# EasyEDA Pro project 集成板.eprj, board 集成板3.1(国赛)
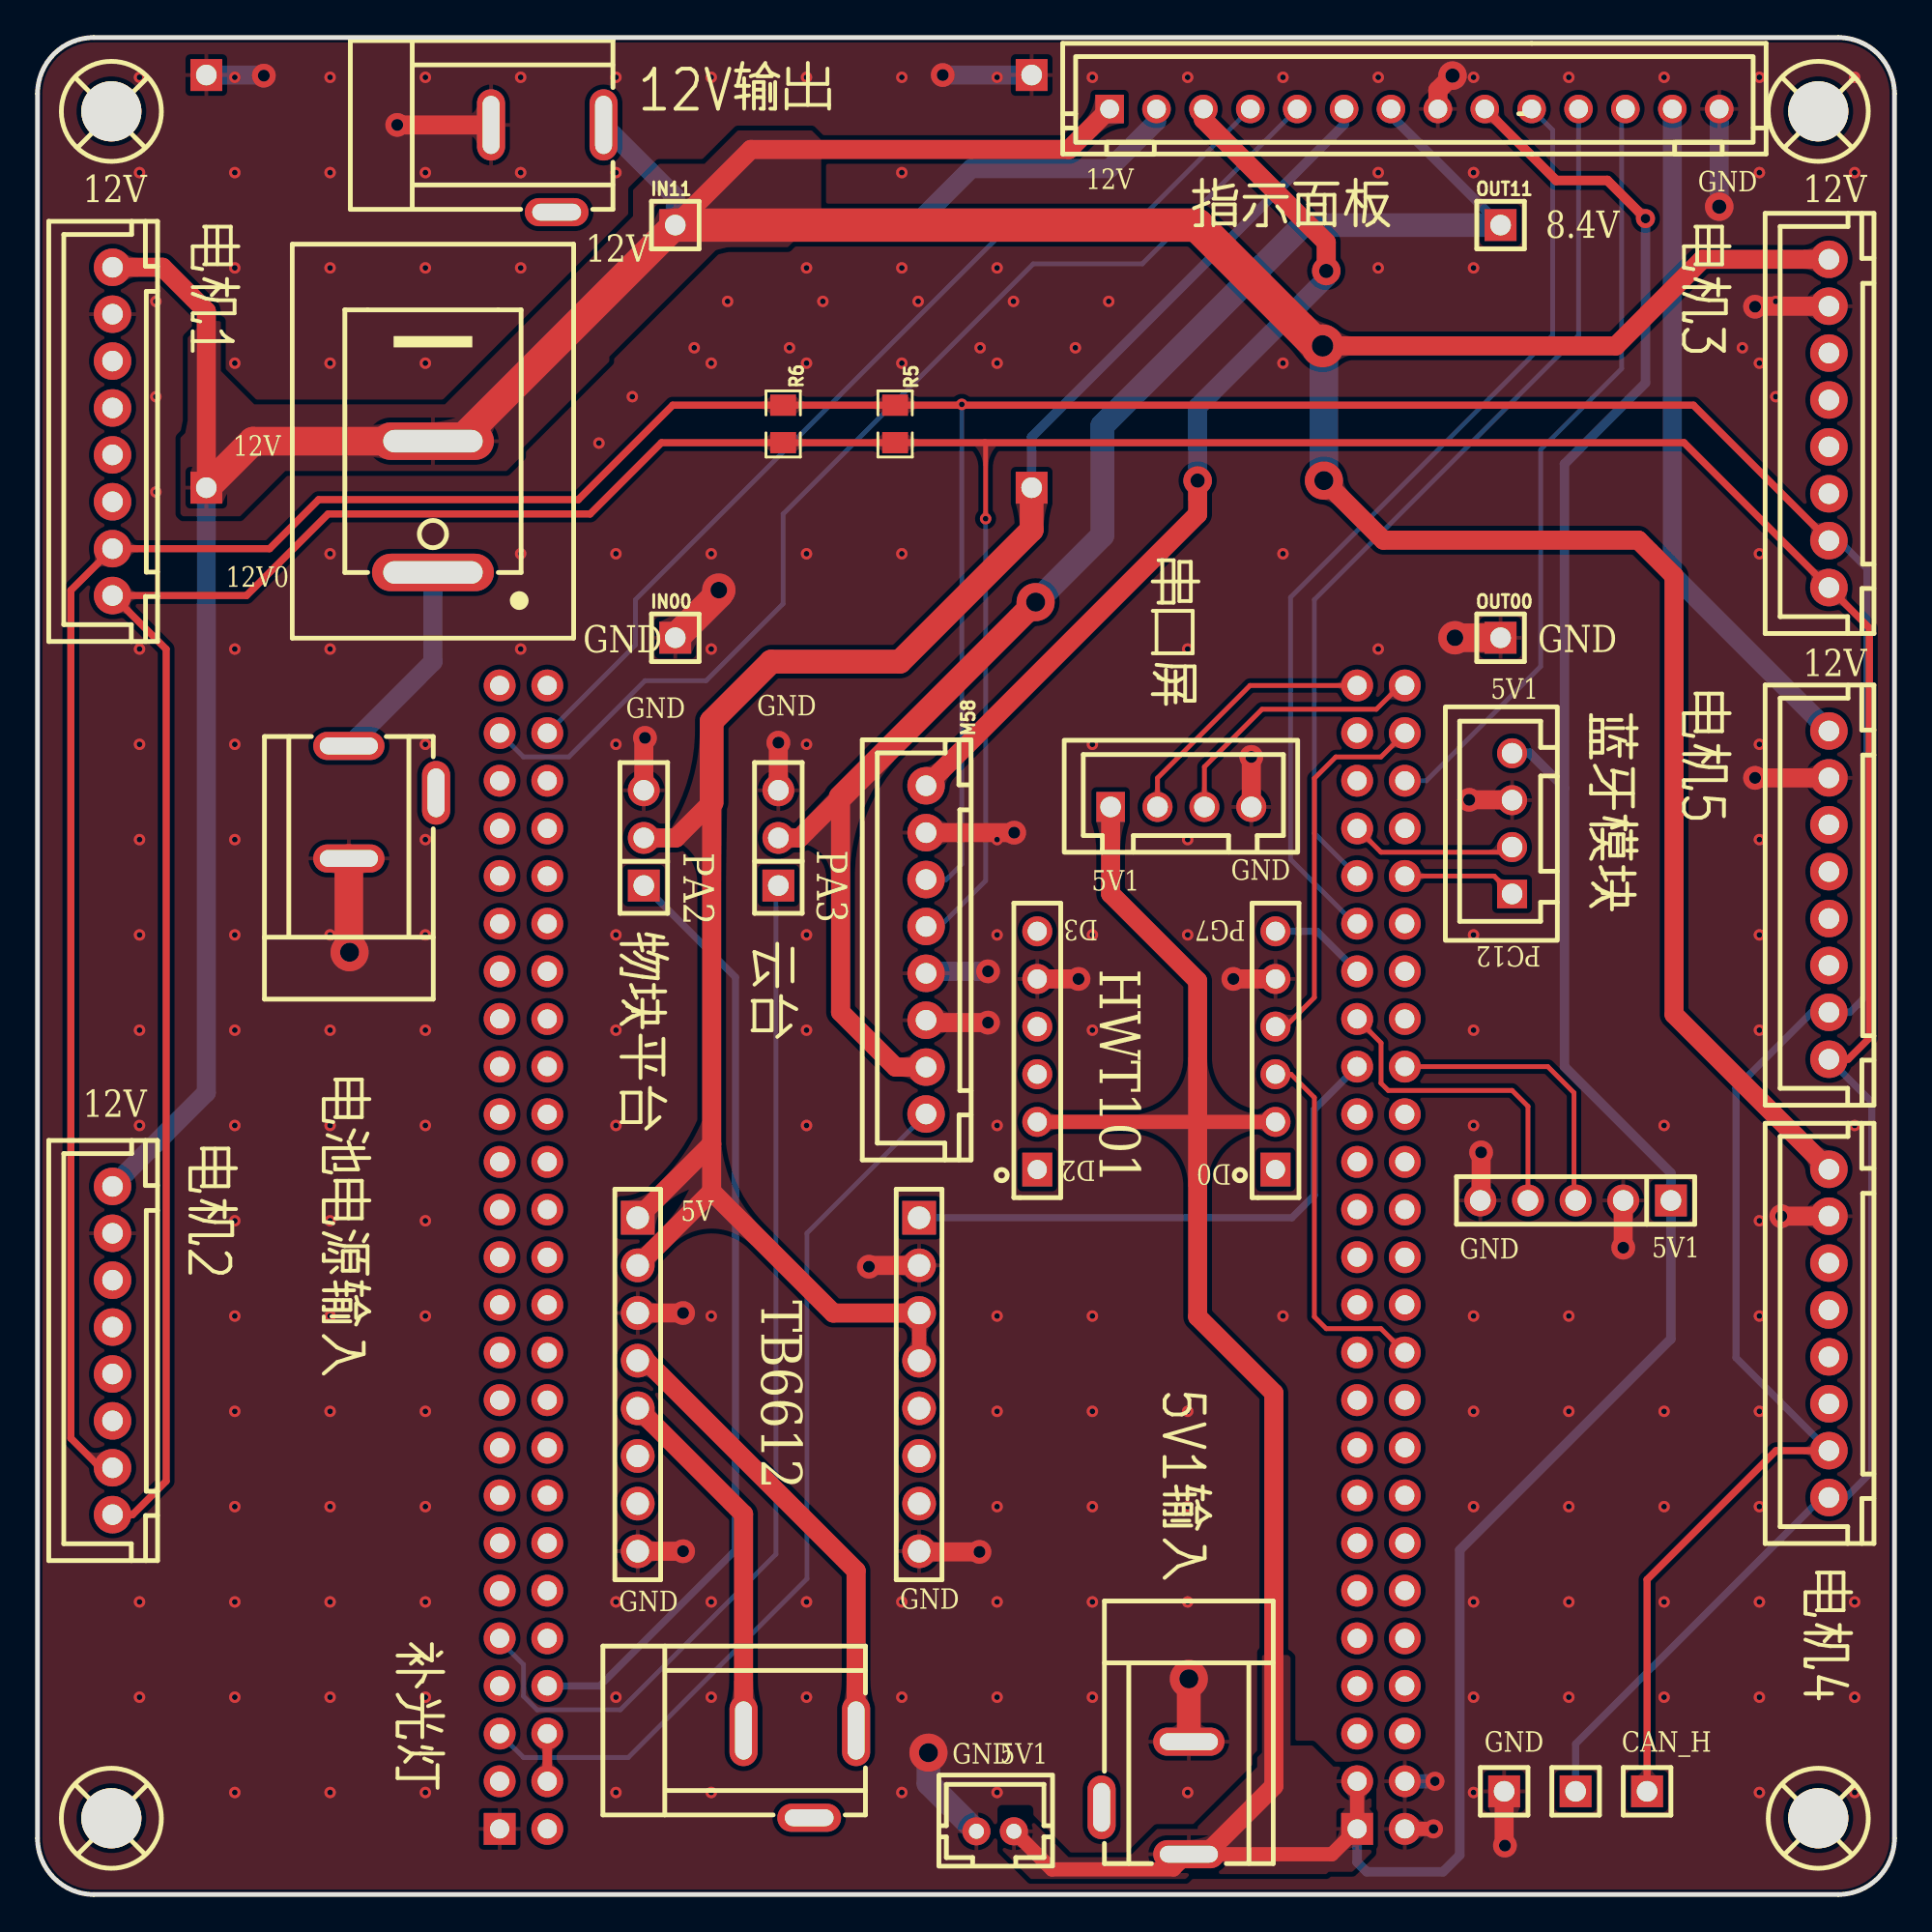
[diagram p10: board, top side]
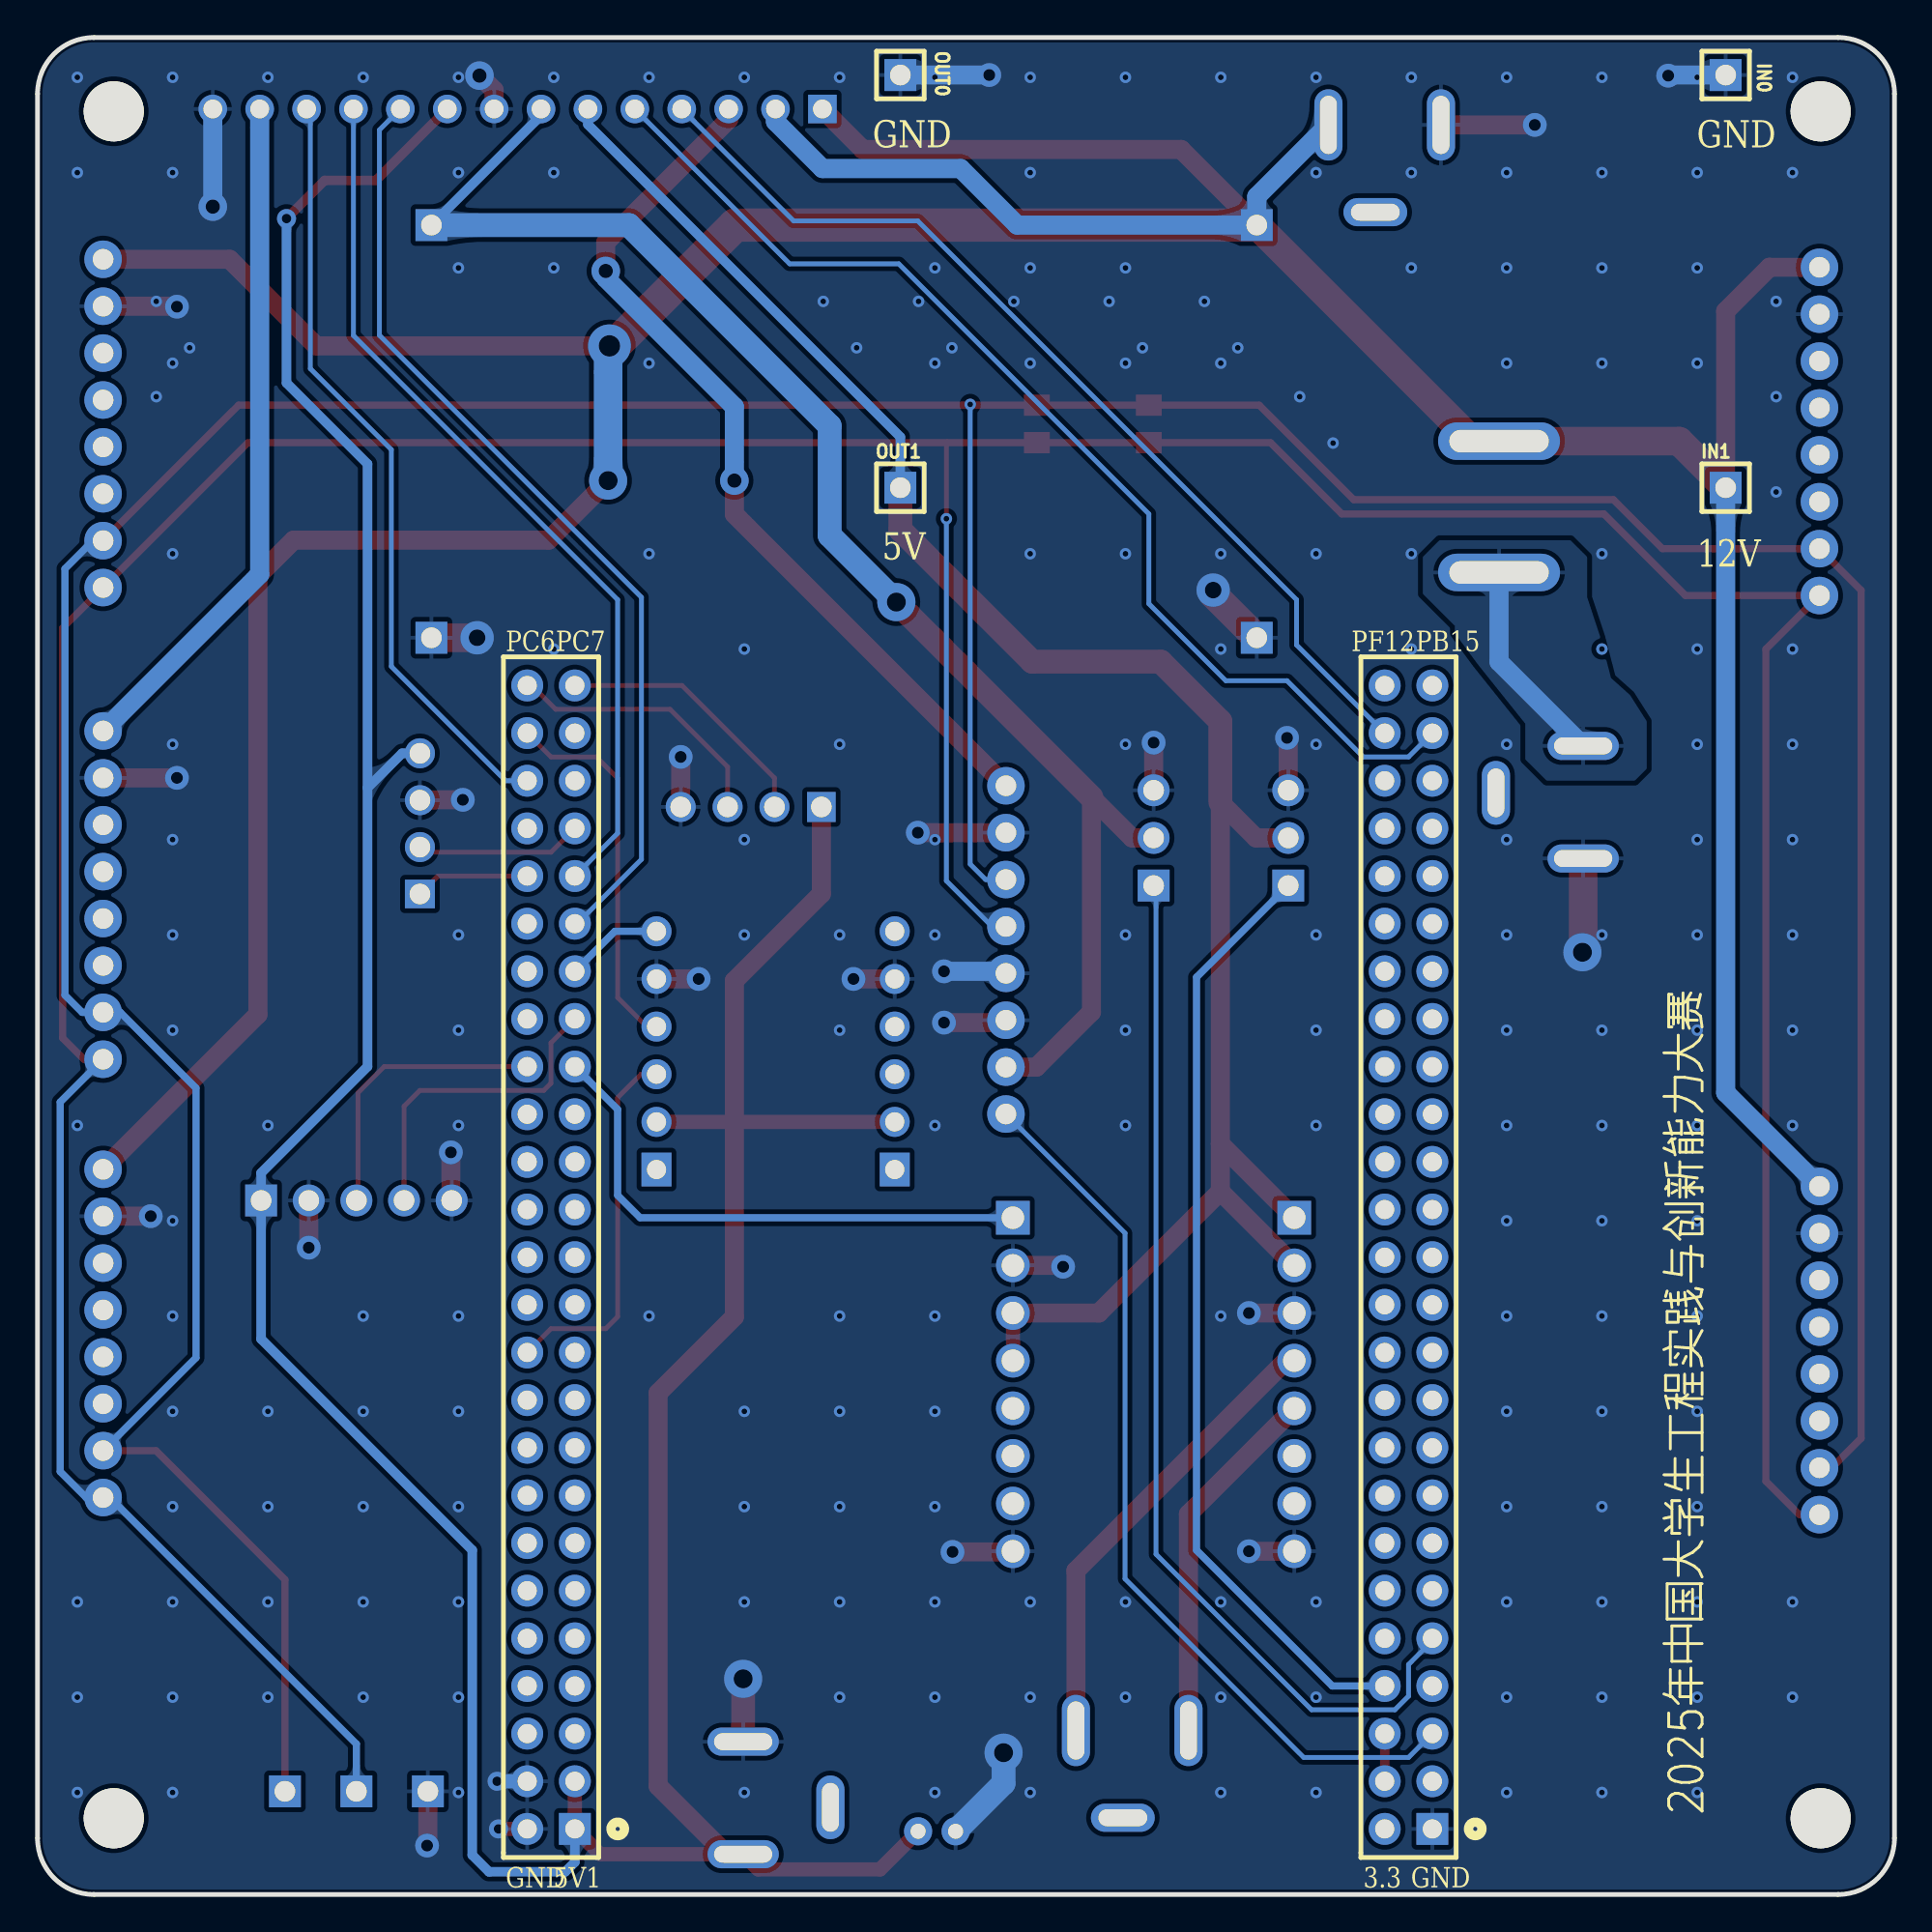
[diagram p11: board, bottom side, seen from below]

Outline 99 x 99 mm; copper layers: Top Layer, Bottom Layer. Coordinates in mm from the lower left corner of the outline.
Outline path: 0,96 0,3 arc(0.88,0.88) 3,0 96,0 arc(98.12,0.88) 99,3 99,96 arc(98.12,98.12) 96,99 3,99 arc(0.88,98.12) 0,96
Stack: Top Layer 0.035mm / Dielectric1 1.51mm FR4 er 4.5 / Bottom Layer 0.035mm

## Design rules (mm)
template: JLCPCB Capability(Two Layers Board)
spacing copperThickness1oz (default): track to track 0.102, other pairs 0.152 to 0.3
spacing copperThickness2oz: track to track 0.203, other pairs 0.152 to 0.3
track width copperThickness1oz (default): min 0.127, default 0.254, max 2.54
track width copperThickness2oz: min 0.203, default 0.254, max 2.54
differential pair differentialPair (default): width min 0.127, default 0.254, max 2.54; gap min 0.152, default 0.152
via viaSize (default): diameter min 0.5, default 0.61, max 10; hole min 0.3, default 0.305, max 6.3

## Placement (name value [footprint] x y rotation side)
CN8  ZX-XH2.54-4PZZ  [CONN-TH_4P-P2.50_4PIN]  78.61 57.09 90 top
CN12  ZX-XH2.54-4PZZ  [CONN-TH_4P-P2.50_4PIN]  60.96 57.98 0 top
CN13  ZX-XH2.54-14PZZ  [CONN-TH_14P-P2.50_ZX-XH2.54-14PZZ]  73.41 95.19 0 top
DC2  DC-005-A200  [DC-IN-TH_DC-005-A200]  59.06 5.15 270 top
DC4  DC-005-A200  [DC-IN-TH_DC-005-A200]  40.64 6.42 0 top
DC5  DC-005-A200  [DC-IN-TH_DC-005-A200]  18.92 58.23 90 top
DC6  DC-005-A200  [DC-IN-TH_DC-005-A200]  27.18 92.02 0 top
H1  PZ254V-11-05P  [HDR-TH_5P-P2.54-V-M]  82 37 180 top
H2  PZ254V-11-01P  [HDR-TH_1P-P2.54-V-M]  85.81 5.5 270 top
H3  PZ254V-11-01P  [HDR-TH_1P-P2.54-V-M]  82 5.5 270 top
H4  PZ254V-11-01P  [HDR-TH_1P-P2.54-V-M]  78.19 5.5 270 top
IN00  2.54-1*1P针  [HDR-TH_1P-P2.54-V-M]  34 67 0 top
IN0  2.54-1*1P针  [HDR-TH_1P-P2.54-V-M]  9 97 180 bottom
IN1  2.54-1*1P针  [HDR-TH_1P-P2.54-V-M]  9 75 180 bottom
IN11  2.54-1*1P针  [HDR-TH_1P-P2.54-V-M]  34 89 0 top
M11  ZX-XH2.54-8PZZ  [CONN-TH_8P-P2.50-XH2.54-8P]  4 78 270 top
M22  ZX-XH2.54-8PZZ  [CONN-TH_8P-P2.50-XH2.54-8P]  4 29 270 top
M33  ZX-XH2.54-8PZZ  [CONN-TH_8P-P2.50-XH2.54-8P]  95.5 78.43 270 top
M44  ZX-XH2.54-8PZZ  [CONN-TH_8P-P2.50-XH2.54-8P]  95.5 29.91 270 top
M55  ZX-XH2.54-8PZZ  [CONN-TH_8P-P2.50-XH2.54-8P]  95.5 53.28 270 top
M58  ZX-XH2.54-8PZZ  [CONN-TH_8P-P2.50-XH2.54-8P]  47.37 50.36 270 top
OUT00  2.54-1*1P针  [HDR-TH_1P-P2.54-V-M]  78 67 0 top
OUT0  2.54-1*1P针  [HDR-TH_1P-P2.54-V-M]  53 97 180 bottom
OUT1  2.54-1*1P针  [HDR-TH_1P-P2.54-V-M]  53 75 180 bottom
OUT11  2.54-1*1P针  [HDR-TH_1P-P2.54-V-M]  78 89 0 top
P1  2.54-1*8P母环保  [HDR-TH_8P-P2.54-V-F-1]  32 27.19 270 top
P2  2.54-1*8P母环保  [HDR-TH_8P-P2.54-V-F-1]  47 27.19 270 top
R5  120Ω  [R0805]  45.72 78.4 270 top
R6  120Ω  [R0805]  39.75 78.4 270 top
SCREW1  -  [M3螺丝]  4 95 0 top
SCREW2  -  [M3螺丝]  4 4 0 top
SCREW3  -  [M3螺丝]  95 95 0 top
SCREW4  -  [M3螺丝]  95 4 0 top
U2  PM254-1-06-Z-8.5  [hdr-th_6p-p2.54-v-f]  66 45 90 top
U3  PM254-1-06-Z-8.5  [hdr-th_6p-p2.54-v-f]  53.3 45 90 top
U21  ZX-PM2.54-2-25PY  [HDR-TH_50P-P2.54-V-F-R2-C25-S2.54-1]  25.91 33.98 90 bottom
U22  ZX-PM2.54-2-25PY  [HDR-TH_50P-P2.54-V-F-R2-C25-S2.54-1]  71.62 33.98 90 bottom
U23  WAFER-PH2.0-2PZZ  [CONN-TH_2P-P2.00_HC-PH-2A-M]  51.05 3.37 0 top
U37  HB-PH3-25413PB2GOP  [HDR-TH_3P-P2.54-V-M]  32.32 56.33 90 top
U38  HB-PH3-25413PB2GOP  [HDR-TH_3P-P2.54-V-M]  39.5 56.33 90 top
U41  SS11-RBIWG-R20-R  [sw-th_l21.0-w15.0_ss11-rbiwg-r20-r]  21.08 73.98 90 top

## Footprints (pads in the part's own frame, mm; a bottom-side part is the same pattern mirrored in y, then rotated)
CONN-TH_2P-P2.00_HC-PH-2A-M
  round 1.5 hole 0.8: 1(-1,0) 2(1,0)
CONN-TH_4P-P2.50_4PIN
  rect 1.524x1.6 hole 1.1: 1(-3.75,0)
  round 1.6 hole 1.1: 2(-1.25,0) 3(1.25,0) 4(3.75,0)
CONN-TH_8P-P2.50-XH2.54-8P
  round 2 hole 1.1: 1(8.75,0) 2(6.25,0) 3(3.75,0) 4(1.25,0) 5(-1.25,0) 6(-3.75,0) 7(-6.25,0) 8(-8.75,0)
CONN-TH_14P-P2.50_ZX-XH2.54-14PZZ
  rect 1.524x1.524 hole 1: 1(-16.25,0)
  round 1.524 hole 1: 2(-13.75,0) 3(-11.25,0) 4(-8.75,0) 5(-6.25,0) 6(-3.75,0) 7(-1.25,0) 8(1.25,0) 9(3.75,0) 10(6.25,0) 11(8.75,0) 12(11.25,0) 13(13.75,0) 14(16.25,0)
DC-IN-TH_DC-005-A200
  oval 1.5x3.8 hole 0.9x3.1: 1(3,2.325) 2(-3,2.325)
  oval 3.4x1.5 hole 2.6x0.9: 3(0.5,-2.325)
HDR-TH_1P-P2.54-V-M
  rect 1.7x1.7 hole 1.1: 1(0,0)
HDR-TH_3P-P2.54-V-M
  rect 1.7x1.7 hole 1.1: 1(-2.54,0)
  round 1.7 hole 1.1: 2(0,0) 3(2.54,0)
HDR-TH_5P-P2.54-V-M
  rect 1.7x1.7 hole 1.1: 1(-5.08,0)
  round 1.7 hole 1.1: 2(-2.54,0) 3(0,0) 4(2.54,0) 5(5.08,0)
hdr-th_6p-p2.54-v-f
  rect 1.8x1.6 hole 1.02: 1(-6.35,0)
  round 1.6 hole 1.02: 2(-3.81,0) 3(-1.27,0) 4(1.27,0) 5(3.81,0) 6(6.35,0)
HDR-TH_8P-P2.54-V-F-1
  rect 1.8x1.8 hole 1.2: 1(-8.89,0)
  round 1.8 hole 1.2: 2(-6.35,0) 3(-3.81,0) 4(-1.27,0) 5(1.27,0) 6(3.81,0) 7(6.35,0) 8(8.89,0)
HDR-TH_50P-P2.54-V-F-R2-C25-S2.54-1
  rect 1.7x1.7 hole 1.02: 1(-30.48,-1.27)
  round 1.7 hole 1.02: 2(-30.48,1.27) 3(-27.94,-1.27) 4(-27.94,1.27) 5(-25.4,-1.27) 6(-25.4,1.27) 7(-22.86,-1.27) 8(-22.86,1.27) 9(-20.32,-1.27) 10(-20.32,1.27) 11(-17.78,-1.27) 12(-17.78,1.27) 13(-15.24,-1.27) 14(-15.24,1.27) 15(-12.7,-1.27) 16(-12.7,1.27) 17(-10.16,-1.27) 18(-10.16,1.27) 19(-7.62,-1.27) 20(-7.62,1.27) 21(-5.08,-1.27) 22(-5.08,1.27) 23(-2.54,-1.27) 24(-2.54,1.27) 25(0,-1.27) 26(0,1.27) 27(2.54,-1.27) 28(2.54,1.27) 29(5.08,-1.27) 30(5.08,1.27) 31(7.62,-1.27) 32(7.62,1.27) 33(10.16,-1.27) 34(10.16,1.27) 35(12.7,-1.27) 36(12.7,1.27) 37(15.24,-1.27) 38(15.24,1.27) 39(17.78,-1.27) 40(17.78,1.27) 41(20.32,-1.27) 42(20.32,1.27) 43(22.86,-1.27) 44(22.86,1.27) 45(25.4,-1.27) 46(25.4,1.27) 47(27.94,-1.27) 48(27.94,1.27) 49(30.48,-1.27) 50(30.48,1.27)
M3螺丝
  round 3.2 hole 3.2: 1(-0.064,0.064)
R0805
  rect 1.133x1.377 smd: 1(-1,0) 2(1,0)
sw-th_l21.0-w15.0_ss11-rbiwg-r20-r
  oval 2x6.5 hole 1.2x5.3: 1(-3.5,0) 2(3.5,0)

## Nets
As in the schematic.

Pads without a net: DC2 3; DC4 3; DC5 3; DC6 3; M11 3 4 5 6; M22 3 4 5 6; M33 3 4 5 6; M44 3 4 5 6; M55 3 4 5 6; P1 6 7; P2 5 6 7; SCREW1 1; SCREW2 1; SCREW3 1; SCREW4 1; U3 3 4

## Via types
v1: diameter 0.61, hole 0.305, Top Layer to Bottom Layer, 201 vias
v2: diameter 2.286, hole 1.143, Top Layer to Bottom Layer, 1 via
v3: diameter 2.032, hole 1.016, Top Layer to Bottom Layer, 5 vias
v4: diameter 1.27, hole 0.635, Top Layer to Bottom Layer, 22 vias
v5: diameter 1.524, hole 0.762, Top Layer to Bottom Layer, 4 vias
v6: diameter 1.778, hole 0.889, Top Layer to Bottom Layer, 2 vias
v7: diameter 1.016, hole 0.508, Top Layer to Bottom Layer, 3 vias

## Routing (per net, layer and track width the routed paths; a pad name or vN(x,y) marks a point on that pad's centre or on a via; arc(x,y) is an arc through that point)
5V: length 107.5
  Top Layer w0.762: P2.3 P2.4
  Top Layer w1.016: 35.94,40.02 P1.1 ; 35.94,40.02 35.94,58.23 34.04,56.33 U37.2 ; 35.94,40.02 35.94,37.48 ; 35.94,37.48 32,33.54 ; 35.94,37.48 42.42,31 P2.3
  Top Layer w1.27: 35.94,58.23 35.94,62.55 39.12,65.73 45.97,65.73 53,72.75 OUT1.1
  Bottom Layer w0.508: CN13.6 69.66,94.36 53,77.7 OUT1.1
5V1: length 214.6
  Top Layer w0.508: CN13.9 80.97,91.38 83.69,91.38 v7(85.72,89.35)
  Top Layer w0.762: U22.3 U22.1 69,2.15 62.28,2.15 ; U3.2 U2.2 ; DC2.1 60.57,1.34 54.09,1.34 U23.2
  Top Layer w1.016: DC2.1 62.28,2.15 65.91,5.78 65.91,26.74 61.85,30.8 61.85,48.71 57.21,53.35 CN12.1
  Bottom Layer w0.508: CN8.4 79.56,60.84 81.41,59 ; 81.41,59 81.41,76.27 85.72,80.58 v7(85.72,89.35) ; 81.41,59 81.41,44.14 87.08,38.46 H1.1 87.08,29.62 75.82,18.36 75.82,2.1 74.93,1.21 70.87,1.21 70.35,1.72 U22.1
8.4V: length 81.3
  Top Layer w1.016: U38.2 40.64,56.33 42.81,58.5 42.81,47.04 45.75,44.11 M58.2
  Top Layer w1.27: v3(53.21,68.9) 42.81,58.5
  Bottom Layer w0.508: OUT11.1 72.16,94.84 CN13.7
  Bottom Layer w1.27: OUT11.1 67.47,89 56.77,78.3 56.77,72.46 v3(53.21,68.9)
12V: length 275.9
  Top Layer w1.016: M44.8 87.25,46.92 87.25,70.3 85.34,72.2 71.75,72.2 v3(68.58,75.38) ; M11.8 6.66,86.75 9,84.41 IN1.1 ; IN11.1 38.03,93.03 55,93.03 CN13.1 ; M33.8 88.76,87.18 84.14,82.56 v2(68.51,82.56)
  Top Layer w1.524: IN1.1 11.48,77.48 U41.2 22.48,77.48 IN11.1
  Top Layer w1.778: v2(68.51,82.56) 68.26,82.56 61.82,89 IN11.1
  Bottom Layer w1.016: IN1.1 9,42.75 M22.8 ; DC6.1 34,90.52 IN11.1 46.77,89 49.78,92.02 57.15,92.02 59.66,94.52 CN13.2
  Bottom Layer w1.524: v3(68.58,75.38) 68.58,82.49 v2(68.51,82.56)
12V0: length 11.1
  Bottom Layer w1.016: DC5.1 21.08,65.72 U41.1
12V5: length 36.6
  Bottom Layer w1.016: CN13.13 87.16,70.38 M55.8
12V6: length 47.6
  Top Layer w1.016: M58.8 61.85,73.59 v5(61.85,75.38) ; v5(68.71,86.55) 68.71,88.08 62.16,94.63 CN13.3
  Bottom Layer w1.016: v5(61.85,75.38) 61.85,79.31 68.71,86.17 v5(68.71,86.55)
GND: length 98.3
  Top Layer w0.762: U22.2 v7(74.42,3.5)
  Top Layer w1.016: M58.3 47.5,46.48 v4(50.67,46.48) ; v4(78.23,2.61) 78.19,2.65 H4.1 ; M58.7 v4(52.07,56.61) ; v5(75.44,96.97) 74.66,96.19 CN13.8 ; v4(50.22,18.26) 47.01,18.26 46.92,18.36 ; DC6.2 v4(19.18,94.34) ; M33.7 91.59,84.68 v4(91.57,84.65) ; v4(76.96,39.56) 76.96,37.04 H1.5 ; M44.7 v4(92.96,36.16) ; v4(76.33,58.36) 78.59,58.36 CN8.3 ; U37.3 32.32,61.6 v4(32.38,61.66) ; 47,33.54 44.39,33.54 v4(44.32,33.47) ; M55.7 v4(91.57,59.53) ; U3.5 v4(55.5,48.81) ; CN12.4 v4(64.71,60.65) ; H1.2 v4(84.54,34.48) ; U2.5 v4(63.75,48.81) ; U38.3 v4(39.5,61.41) ; P1.3 v4(34.42,31) ; 32,18.3 v4(34.42,18.3)
  Top Layer w1.27: DC2.2 v3(61.38,11.5)
  Top Layer w1.524: v3(16.64,50.23) 16.6,50.27 DC5.2 ; OUT00.1 v6(75.56,67) ; v6(36.32,69.54) 36.32,69.32 IN00.1
  Bottom Layer w0.762: U22.4 v7(74.5,6.04)
  Bottom Layer w1.016: M58.4 47.48,49.22 v4(50.67,49.22) ; IN0.1 12.03,97 v4(12.06,96.97) ; OUT0.1 v4(48.26,97) ; CN13.14 v5(89.66,89.98)
  Bottom Layer w1.27: v3(47.5,7.56) 47.5,5.93 U23.1
  vias: v1(5.44,96.88) v1(5.44,91.8) v1(5.44,66.4) v1(5.44,61.32) v1(5.44,56.24) v1(5.44,51.16) v1(5.44,46.08) v1(5.44,41) v1(5.44,15.6) v1(5.44,10.52) v1(6.31,84.93) v1(6.31,79.85) v1(6.31,74.77) v1(10.52,96.88) v1(10.52,91.8) v1(10.52,86.72) v1(10.52,81.64) v1(10.52,66.4) v1(10.52,61.32) v1(10.52,56.24) v1(10.52,51.16) v1(10.52,46.08) v1(10.52,41) v1(10.52,35.92) v1(10.52,30.84) v1(10.52,25.76) v1(10.52,20.68) v1(10.52,15.6) v1(10.52,10.52) v1(10.52,5.44) v1(15.6,96.88) v1(15.6,91.8) v1(15.6,86.72) v1(15.6,81.64) v1(15.6,71.48) v1(15.6,66.4) v1(15.6,51.16) v1(15.6,46.08) v1(15.6,41) v1(15.6,35.92) v1(15.6,30.84) v1(15.6,25.76) v1(15.6,20.68) v1(15.6,15.6) v1(15.6,10.52) v1(15.6,5.44) v1(20.68,96.88) v1(20.68,91.8) v1(20.68,86.72) v1(20.68,81.64) v1(20.68,61.32) v1(20.68,56.24) v1(20.68,51.16) v1(20.68,46.08) v1(20.68,41) v1(20.68,35.92) v1(20.68,30.84) v1(20.68,25.76) v1(20.68,20.68) v1(20.68,15.6) v1(20.68,10.52) v1(20.68,5.44) v1(25.76,96.88) v1(25.76,91.8) v1(25.76,86.72) v1(25.76,71.48) v1(25.76,66.4) v1(29.93,77.38) v1(30.84,96.88) v1(30.84,91.8) v1(30.84,71.48) v1(30.84,61.32) v1(30.84,51.16) v1(30.84,46.08) v1(30.84,41) v1(30.84,15.6) v1(30.84,10.52) v1(30.84,5.44) v1(31.71,79.85) v1(35.01,82.46) v1(35.92,96.88) v1(35.92,81.64) v1(35.92,71.48) v1(35.92,66.4) v1(35.92,30.84) v1(35.92,15.6) v1(35.92,10.52) v1(35.92,5.44) v1(36.79,84.93) v1(40.09,82.46) v1(41,96.88) v1(41,86.72) v1(41,81.64) v1(41,71.48) v1(41,61.32) v1(41,51.16) v1(41,46.08) v1(41,41) v1(41,15.6) v1(41,10.52) v1(41.87,84.93) v1(46.08,96.88) v1(46.08,91.8) v1(46.08,86.72) v1(46.08,81.64) v1(46.08,71.48) v1(46.08,15.6) v1(46.08,10.52) v1(46.08,5.44) v1(46.95,84.93) v1(50.25,82.46) v1(51.16,96.88) v1(51.16,86.72) v1(51.16,81.64) v1(51.16,56.24) v1(51.16,51.16) v1(51.16,41) v1(51.16,30.84) v1(51.16,25.76) v1(51.16,20.68) v1(51.16,15.6) v1(51.16,10.52) v1(51.16,5.44) v1(52.03,84.93) v1(55.33,82.46) v1(56.24,96.88) v1(56.24,61.32) v1(56.24,51.16) v1(56.24,46.08) v1(56.24,30.84) v1(56.24,25.76) v1(56.24,20.68) v1(56.24,15.6) v1(56.24,10.52) v1(57.11,84.93) v1(61.32,96.88) v1(61.32,66.4) v1(61.32,56.24) v1(61.32,51.16) v1(61.32,25.76) v1(61.32,20.68) v1(61.32,15.6) v1(61.32,5.44) v1(66.4,96.88) v1(66.4,81.64) v1(66.4,71.48) v1(66.4,30.84) v1(71.48,96.88) v1(71.48,91.8) v1(71.48,86.72) v1(71.48,66.4) v1(76.56,96.88) v1(76.56,91.8) v1(76.56,86.72) v1(76.56,51.16) v1(76.56,46.08) v1(76.56,41) v1(76.56,30.84) v1(76.56,25.76) v1(76.56,20.68) v1(76.56,15.6) v1(76.56,10.52) v1(76.56,5.44) v1(81.64,96.88) v1(81.64,30.84) v1(81.64,25.76) v1(81.64,20.68) v1(81.64,15.6) v1(81.64,10.52) v1(86.72,96.88) v1(86.72,41) v1(86.72,25.76) v1(86.72,20.68) v1(86.72,15.6) v1(86.72,10.52) v1(90.89,82.46) v1(91.8,96.88) v1(91.8,91.8) v1(91.8,81.64) v1(91.8,71.48) v1(91.8,61.32) v1(91.8,56.24) v1(91.8,51.16) v1(91.8,46.08) v1(91.8,35.92) v1(91.8,30.84) v1(91.8,25.76) v1(91.8,20.68) v1(91.8,15.6) v1(91.8,10.52) v1(91.8,5.44) v1(92.67,84.93) v1(92.67,79.85) v1(96.88,96.88) v1(96.88,91.8) v1(96.88,41) v1(96.88,15.6) v1(96.88,10.52) v1(96.88,5.44)
VCC3.3VREF: length 2.5
  Top Layer w0.508: U21.6 U21.4
AO1: length 24.8
  Top Layer w1.016: DC4.1 43.64,17.26 32.44,28.46 P1.4
AO2: length 19.5
  Top Layer w1.016: 32,25.92 37.64,20.28 DC4.2
CAN_H: length 255.3
  Top Layer w0.381: M22.2 3.35,22.75 1.78,24.32 1.78,69.53 M11.2 12.37,71.75 14.99,74.36 28.83,74.36 33.87,79.4 R6.1 R5.1 88.28,79.4 M33.2 ; H2.1 85.81,16.79 92.68,23.66 M44.2
  Bottom Layer w0.254: M58.6 48.45,54.11 49.28,54.93 v1(49.28,79.44)
  Bottom Layer w0.381: M44.2 90.55,28.62 90.55,42.99 94.59,47.03 M55.2 96.62,47.03 97.54,47.95 97.54,70.68 96.04,72.18 M33.2
CAN_L: length 252.4
  Top Layer w0.254: 50.5,77.4 50.55,77.36 v1(50.55,73.35)
  Top Layer w0.381: M22.1 5.07,20.25 6.86,22.04 6.86,66.39 M11.1 11.14,69.25 15.49,73.6 29.46,73.6 33.26,77.4 R6.2 R5.2 87.78,77.4 M33.1 97.66,67.52 97.66,45.66 96.53,44.53 M55.1
  Bottom Layer w0.254: M58.5 48.11,51.61 50.55,54.04 v1(50.55,73.35)
  Bottom Layer w0.381: H3.1 82,8.03 95.14,21.16 M44.1 96.41,21.16 97.79,22.55 97.79,42.24 M55.1
PA1: length 48.3
  Bottom Layer w0.254: U21.5 25.91,7.31 31.5,7.31 41.02,16.83 41.02,35.26 M58.1
PA2: length 50.5
  Bottom Layer w0.381: U37.1 37.21,48.9 37.21,18.35 29.97,11.12 U21.8
PA3: length 56.5
  Bottom Layer w0.254: U21.9 24.64,13.53 25.91,12.26 25.91,10.57 26.63,9.85 31.07,9.85 39.37,18.14 39.37,53.66 U38.1
PA6: length 29.4
  Bottom Layer w0.381: P2.1 66.87,36.08 68.07,37.28 68.07,41.86 U22.33
PA8: length 47.7
  Bottom Layer w0.254: CN13.11 82.16,83.11 68.07,69.03 68.07,56.58 U22.41
PA11: length 17.3
  Top Layer w0.254: U22.35 71.63,45.4 71.63,43.25 72.01,42.87 78.61,42.87 79.46,42.02 H1.4
PA12: length 15.4
  Top Layer w0.254: U22.34 80.52,44.14 81.91,42.74 81.91,37.08 H1.3
PC6: length 14.6
  Top Layer w0.254: U22.50 72.64,64.46 71.37,63.19 65.28,63.19 62.21,60.12 CN12.3
PC7: length 14.2
  Top Layer w0.254: U22.49 64.64,64.46 59.71,59.52 CN12.2
PC9: length 51.2
  Bottom Layer w0.254: CN13.10 80.77,94.07 80.77,83.12 66.8,69.16 66.8,55.19 70.23,51.76 U22.39
PC12: length 6.1
  Top Layer w0.254: CN8.1 77.66,54.3 U22.42
PD2: length 8.9
  Top Layer w0.254: U22.43 71.62,55.57 78.34,55.57 CN8.2
PD5: length 19.9
  Top Layer w0.254: U2.3 66.83,43.73 68.07,42.48 68.07,30.8 68.71,30.17 71.62,30.17 U22.22
PD6: length 20.2
  Top Layer w0.254: U2.4 66.52,46.27 68.07,47.82 68.07,59.5 69.22,60.65 71.62,60.65 U22.48
PF0: length 60.2
  Bottom Layer w0.254: U21.47 25.91,60.65 28.32,60.65 32.38,64.71 35.65,64.71 39.75,68.81 39.75,73.6 53.09,86.94 58.9,86.94 CN13.5
PF1: length 52.7
  Bottom Layer w0.254: CN13.4 58.69,89.22 52.07,89.22 31.88,69.03 31.88,66.61 U21.48
PG7: length 5.2
  Bottom Layer w0.381: U2.6 68.22,51.35 U22.37
PG15: length 41.4
  Bottom Layer w0.254: U22.46 74.04,59.38 80.14,65.47 80.14,77.03 84.46,81.35 84.46,94.99 CN13.12

## Copper pours and planes (outline as drawn; the poured copper is in the pictures)
5V1 on Top Layer: 61.47,1.08 68.71,1.08 68.83,1.21 70.1,1.21 71.12,2.23 71.12,6.41 70.71,6.82 69.08,6.82 67.96,7.94 66.8,7.94 66.8,12.64 66.68,12.77 65.41,12.77 65.28,12.89 65.28,7.56 65.02,7.31 65.02,6.8 61.85,3.62 61.85,3.5 59.69,3.5 58.18,1.99 58.18,1.98 54.98,1.98 52.83,4.13 52.83,4.51 51.44,4.51 51.44,2.35 52.96,0.83 61.21,0.83
12V on Top Layer: 7.75,73.47 7.62,73.6 7.62,77.66 7.87,77.92 8,78.55 8,83 8.51,83.51 8.51,83.89 9.78,83.89 9.78,81.22 11.56,79.44 21.72,79.44 31.75,89.47 31.75,90.87 33.15,92.27 35.56,92.27 37.34,94.05 41.28,94.05 41.78,93.54 41.78,89.6 40,87.82 36.32,87.82 30.48,81.98 30.48,81.73 25.78,77.03 25.78,76.66 25.01,75.89 13.21,75.89 10.8,73.47
12V0 on Bottom Layer: 16.38,69.16 16.38,71.31 17.27,72.2 24.26,72.2 25.15,71.31 25.15,69.34 23.44,67.63 23.44,67.24 22.22,65.6 19.69,62.42 19.69,60.52 18.54,59.38 13.84,59.38 13.21,60.01 13.21,62.55 14.1,63.95 15.11,64.85 15.67,66.98
GND on Top Layer: -12.95,109.54 113.66,109.54 113.66,-9.84 -12.95,-9.84
GND on Bottom Layer: -11.94,109.8 114.68,109.8 114.68,-11.11 -11.94,-11.11

Small or netless copper shapes (teardrops, artwork), in the pictures only: 134 on Top Layer, 70 on Bottom Layer

## Text on the board
Bottom Silkscreen Layer: PB15 | GND | 3.3 | PF12 | PC7 | 5V1 | PC6 | 12V | 5V | 2025年中国大学生工程实践与创新能力大赛
Top Silkscreen Layer: 12V0 | 12V | GND | 5V | 5V1 | CAN_H | D2 | D3 | D0 | PG7 | PC12 | 8.4V | PA2 | PA3 | 电机2 | 电机1 | 物块平台 | 云台 | TB6612 | HWT101 | 串口屏 | 5V1输入 | 蓝牙模块 | 电机3 | 电机5 | 电机4 | 12V输出 | 指示面板 | 电池电源输入 | 补光灯
